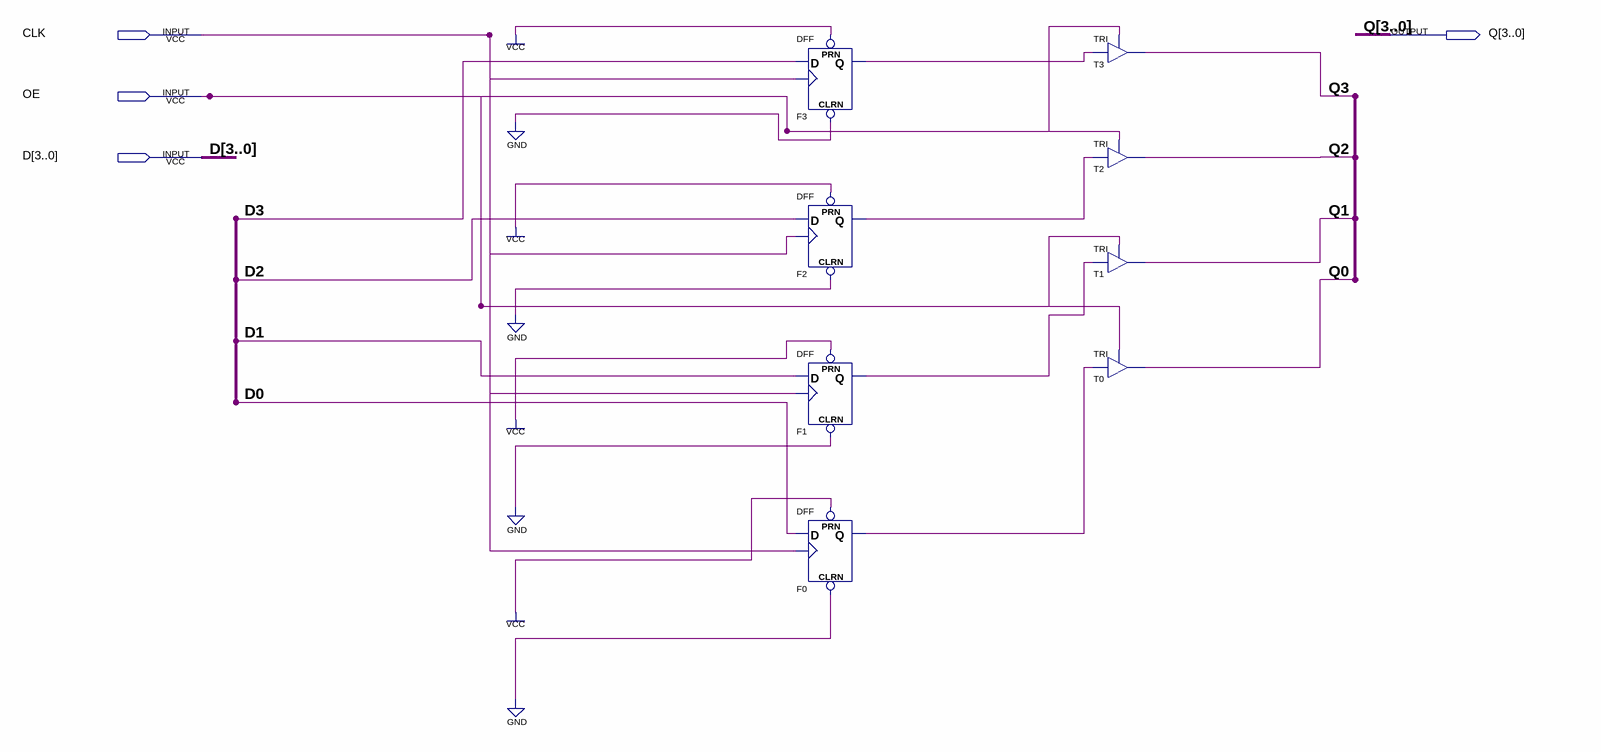
[diagram p0: schematic sheet]
// Quartus schematic REG4.bdf as structural Verilog: 8 symbols, 4 pins
module REG4 (
  input  CLK,
  input  OE,
  input  [3:0] D,
  output [3:0] Q
);

  wire F0_q, F1_q, F2_q, F3_q;

  DFF F3 (.CLRN(1'b0), .CLK(CLK), .D(D[3]), .PRN(1'b1), .Q(F3_q));
  DFF F2 (.CLRN(1'b0), .CLK(CLK), .D(D[2]), .PRN(1'b1), .Q(F2_q));
  DFF F1 (.CLRN(1'b0), .CLK(CLK), .D(D[1]), .PRN(1'b1), .Q(F1_q));
  DFF F0 (.CLRN(1'b0), .CLK(CLK), .D(D[0]), .PRN(1'b1), .Q(F0_q));
  TRI T3 (.IN(F3_q), .OE(OE), .OUT(Q[3]));
  TRI T2 (.IN(F2_q), .OE(OE), .OUT(Q[2]));
  TRI T1 (.IN(F1_q), .OE(OE), .OUT(Q[1]));
  TRI T0 (.IN(F0_q), .OE(OE), .OUT(Q[0]));
endmodule
